# Altium project 2026_HSS_Kontrocu_Karti.PrjPcb
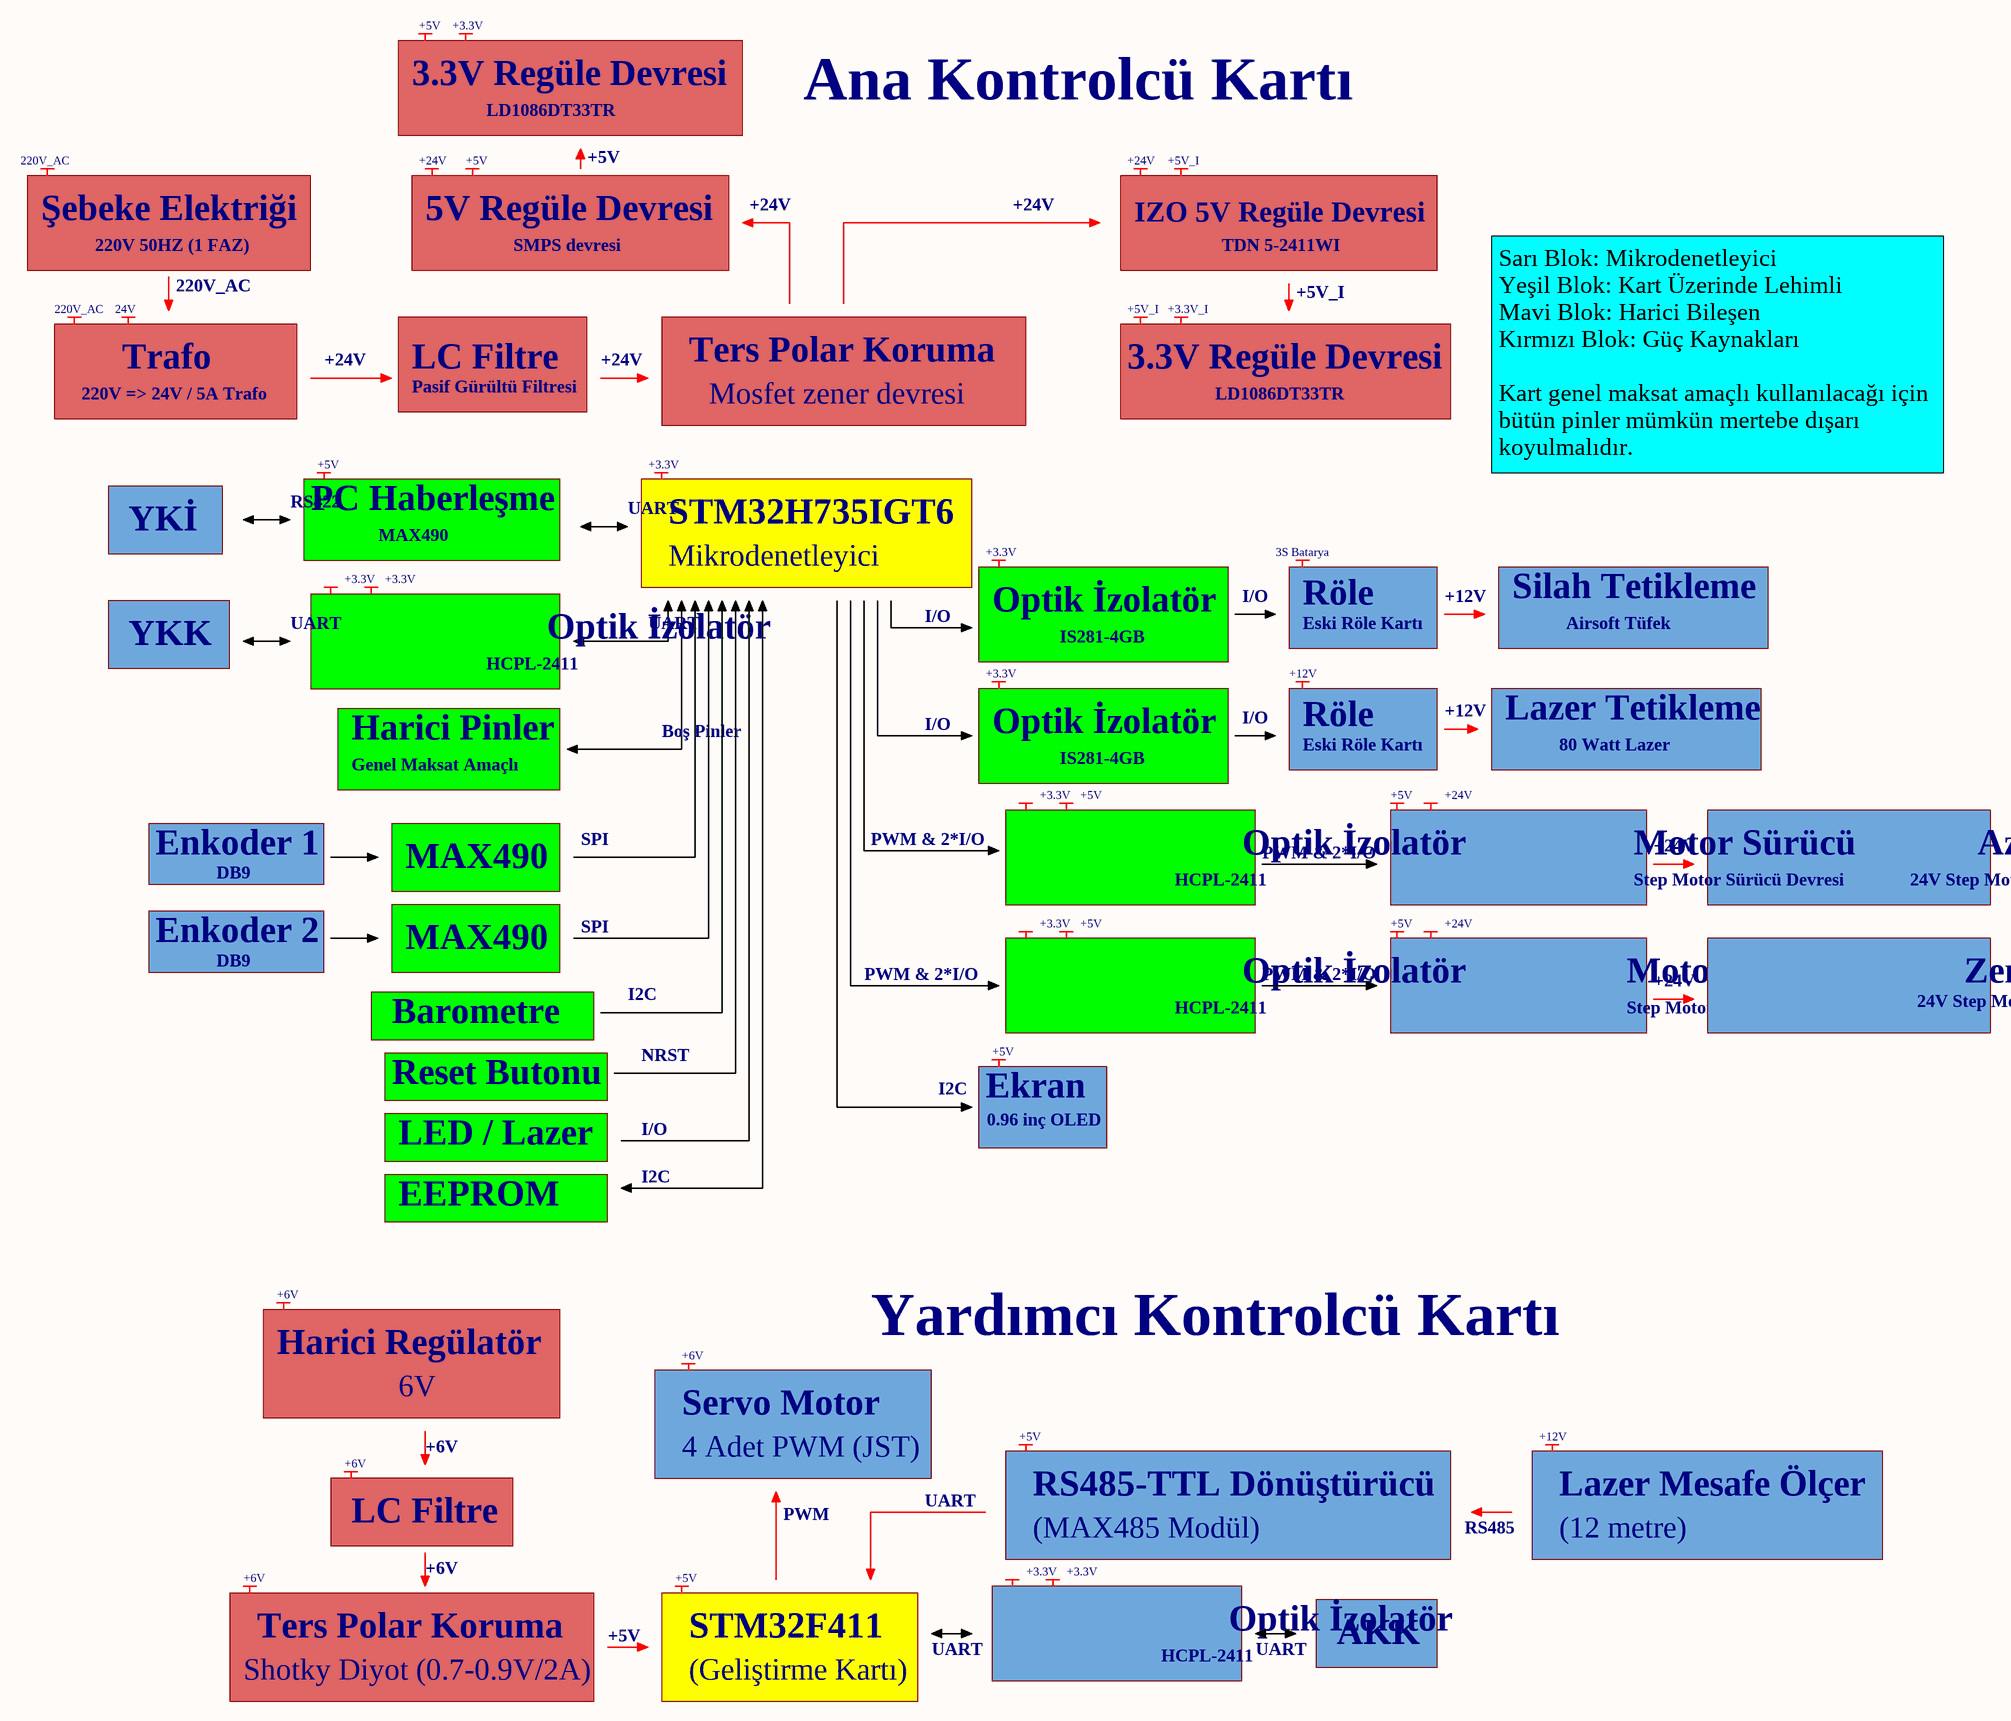
[diagram p0: HSS 2026 Blok Diyagram.SchDoc]
7 sheets, 289 parts. Net scope: global (net labels, ports and power ports of the same name join across sheets).
Board file: HSS_2026_PCB.PcbDoc
Sheets:
  HSS 2026 Blok Diyagram.SchDoc
  Power Sematik.SchDoc
  STM32 Sematik.SchDoc
  Dahili Moduller 1.SchDoc
  Harici Moduller.SchDoc
  Dahili Moduller 2.SchDoc
  Dahili Moduller 3.SchDoc

## Sheet HSS 2026 Blok Diyagram.SchDoc
size A2; SheetNumber: 1; SheetTotal: 7

### Notes on the sheet
- +5V
- +3.3V
- 3.3V Regüle Devresi
- 220V_AC
- +24V
- LD1086DT33TR
- Ana Kontrolcü Kartı
- +5V_I
- Şebeke Elektriği
- 5V Regüle Devresi
- IZO 5V Regüle Devresi
- 220V 50HZ (1 FAZ)
- 24V
- SMPS devresi
- +3.3V_I
- TDN 5-2411WI
- Trafo
- LC Filtre
- Ters Polar Koruma
- 220V => 24V / 5A Trafo
- Pasif Gürültü Filtresi
- Mosfet zener devresi
- RS422
- Sarı Blok: Mikrodenetleyici
  Yeşil Blok: Kart Üzerinde Lehimli
  Mavi Blok: Harici Bileşen
  Kırmızı Blok: Güç Kaynakları
  Kart genel maksat amaçlı kullanılacağı için bütün pinler mümkün mertebe dışarı koyulmalıdır.
- YKİ
- PC Haberleşme
- MAX490
- UART
- STM32H735IGT6
- Mikrodenetleyici
- 3S Batarya
- Optik İzolatör
- I/O
- IS281-4GB
- Röle
- Eski Röle Kartı
- +12V
- Silah Tetikleme
- Airsoft Tüfek
- YKK
- HCPL-2411
- Reset Butonu
  2 Kristal
  Uyarı LED'leri
  Boş butonlar
  PWM/+5V/GND
- Harici Pinler
- Genel Maksat Amaçlı
- Boş Pinler
- Lazer Tetikleme
- 80 Watt Lazer
- SPI
- PWM & 2*I/O
- Enkoder 1
- DB9
- Motor Sürücü
- Step Motor Sürücü Devresi
- 24V Step Motor
- Azimuth Motoru
- Enkoder 2
- Zenith Motoru
- Barometre
- I2C
- Reset Butonu
- NRST
- Ekran
- LED / Lazer
- 0.96 inç OLED
- EEPROM
- +6V
- Harici Regülatör
- Yardımcı Kontrolcü Kartı
- 6V
- Servo Motor
- 4 Adet PWM (JST)
- PWM
- RS485-TTL Dönüştürücü
- Lazer Mesafe Ölçer
- (MAX485 Modül)
- RS485
- (12 metre)
- STM32F411
- AKK
- Shotky Diyot (0.7-0.9V/2A)
- Dikkat kartın regülatörü max 5.25V
- (Geliştirme Kartı)

## Sheet Power Sematik.SchDoc
size A4; SheetNumber: 2; SheetTotal: 7
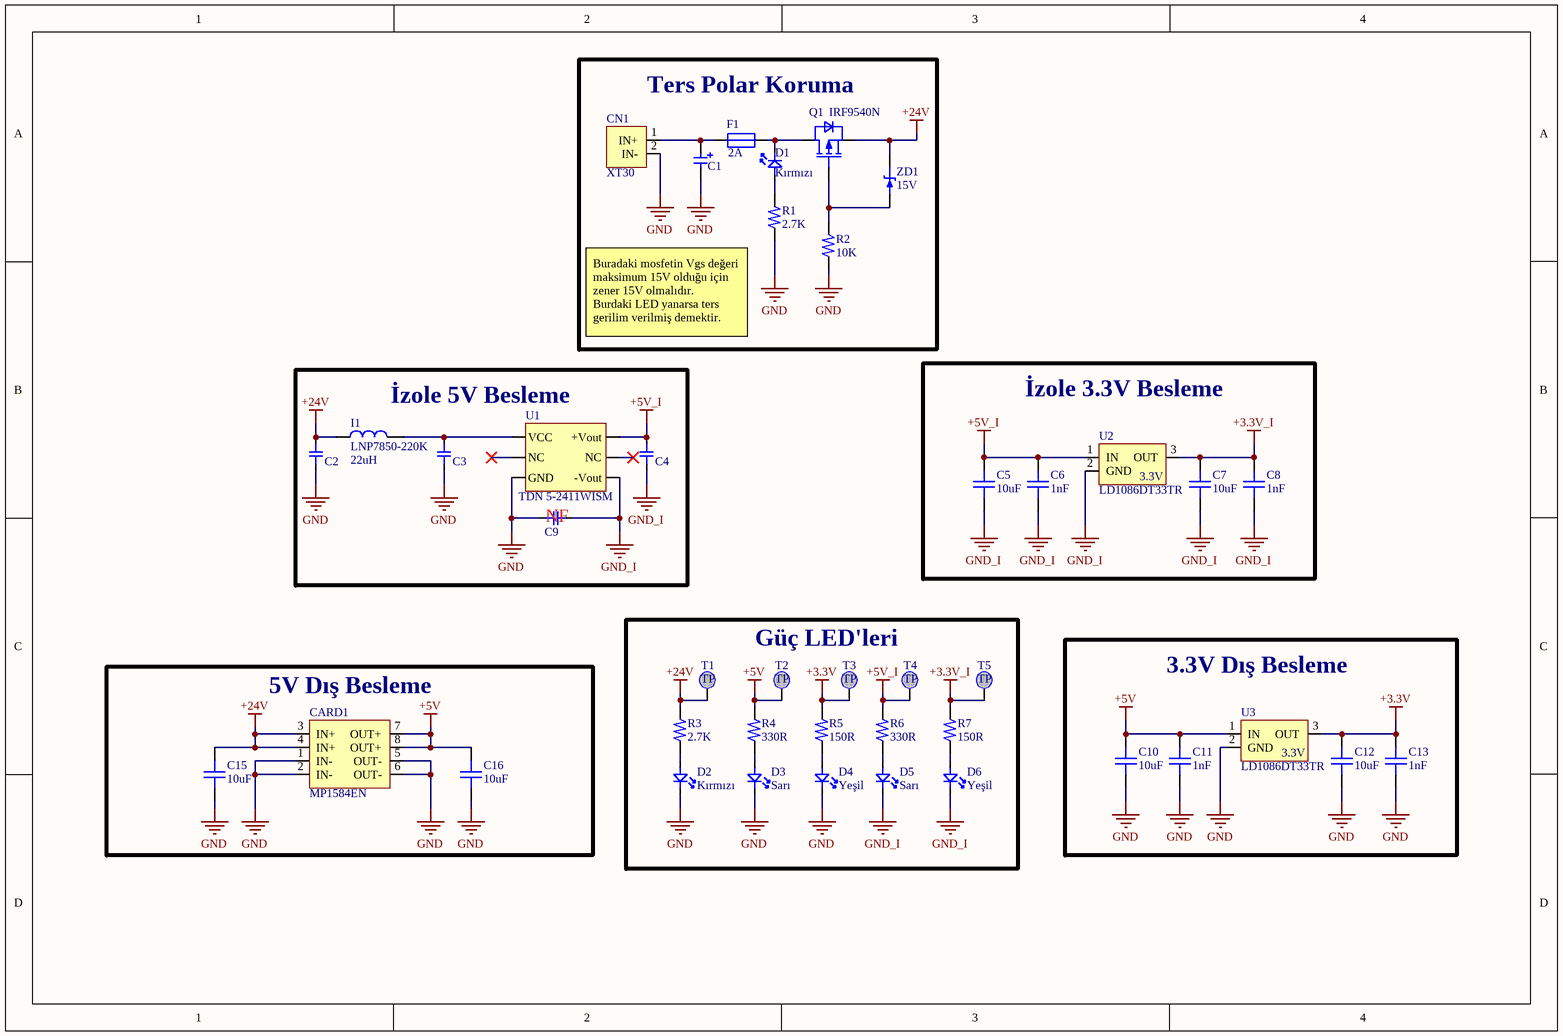
[diagram p1: Power Sematik.SchDoc]

### Parts
C1  CAP_Elec  [CAP_Elec]  (value not drawn)
C2  10uF/50V  [1206_Kapasitör]  (value not drawn)
C3  2.2uF/50V  [1206_Kapasitör]  (value not drawn)
C4  10uF  [1206_Kapasitör]  (value not drawn)
C5  10uF  [0805 Kapasıtor]
C6  1nF  [0805 Kapasıtor]
C7  10uF  [0805 Kapasıtor]
C8  1nF  [0805 Kapasıtor]
C9  330pF/3kV  [1206_Kapasitör]  (value not drawn)
C10  10uF  [0805 Kapasıtor]
C11  1nF  [0805 Kapasıtor]
C12  10uF  [0805 Kapasıtor]
C13  1nF  [0805 Kapasıtor]
C15  10uF  [0805 Kapasıtor]
C16  10uF  [0805 Kapasıtor]
CARD1  MP1584EN  [MP1584]
CN1  XT30  [XT30]
D1  Kırmızı  [0805 LED]
D2  Kırmızı  [0805 LED]
D3  Sarı  [0805 LED]
D4  Yeşil  [0805 LED]
D5  Sarı  [0805 LED]
D6  Yeşil  [0805 LED]
F1  2A  [1808_Sigorta]
I1  LNP7850-220K  value 22uH  [LPN7850]
Q1  IRF9540N  [IFX-PG-TO220-3-904-1]
R1  2.7K  [0805 Dırenc]
R2  10K  [0805 Dırenc]
R3  2.7K  [0805 Dırenc]
R4  330R  [0805 Dırenc]
R5  150R  [0805 Dırenc]
R6  330R  [0805 Dırenc]
R7  150R  [0805 Dırenc]
T1  Test Noktası  [Test Noktası]  (value not drawn)
T2  Test Noktası  [Test Noktası]  (value not drawn)
T3  Test Noktası  [Test Noktası]  (value not drawn)
T4  Test Noktası  [Test Noktası]  (value not drawn)
T5  Test Noktası  [Test Noktası]  (value not drawn)
U1  TDN 5-2411WISM  [Traco 5WISM]
U2  LD1086DT33TR  [DPAK]
U3  LD1086DT33TR  [DPAK]
ZD1  15V  [Zener_Diyot]

### Blocks framed on the sheet
Ters Polar Koruma: C1 CN1 D1 F1 Q1 R1 R2 ZD1
İzole 5V Besleme: C2-C4 C9 I1 U1
İzole 3.3V Besleme: C5-C8 U2
Güç LED'leri: D2-D6 R3-R7 T1-T5
5V Dış Besleme: C15 C16 CARD1
3.3V Dış Besleme: C10-C13 U3

### Nets
+3.3V: C12.2 C13.2 R5.2 T3.1 U3.3(OUT)
+3.3V_I: C7.2 C8.2 R7.2 T5.1 U2.3(OUT)
+5V: C10.2 C11.2 C16.2 CARD1.7(OUT+) CARD1.8(OUT+) R4.2 T2.1 U3.1(IN)
+5V_I: C4.1 C5.2 C6.2 R6.2 T4.1 U1.7(+Vout) U2.1(IN)
+24V: C2.2 C15.2 CARD1.3(IN+) CARD1.4(IN+) I1.1 Q1.3(SOURCE) R3.2 T1.1 ZD1.2(K)
GND: C1.2 C2.1 C3.1 C9.2 C10.1 C11.1 C12.1 C13.1 C15.1 C16.1 CARD1.1(IN-) CARD1.2(IN-) CARD1.5(OUT-) CARD1.6(OUT-) CN1.2(IN-) D2.2 D3.2 D4.2 R1.1 R2.1 U1.2(GND) U3.2(GND)
GND_I: C4.2 C5.1 C6.1 C7.1 C8.1 C9.1 D5.2 D6.2 U1.6(-Vout) U2.2(GND)
NetC1_1: C1.1 CN1.1(IN+) F1.1
NetC3_2: C3.2 I1.2 U1.1(VCC)
NetD1_1: D1.1 R1.2
NetD1_2: D1.2 F1.2 Q1.2(DRAIN)
NetD2_1: D2.1 R3.1
NetD3_1: D3.1 R4.1
NetD4_1: D4.1 R5.1
NetD5_1: D5.1 R6.1
NetD6_1: D6.1 R7.1
NetQ1_1: Q1.1(GATE) R2.2 ZD1.1(A)

Not connected (* = marked no-connect by the designer): U1 4(NC)* 5(NC)*

### Notes on the sheet
- (near R1) Buradaki mosfetin Vgs değeri maksimum 15V olduğu için zener 15V olmalıdır.
  Burdaki LED yanarsa ters gerilim verilmiş demektir.
- (near C9) NF
- (in symbol LD1086DT33TR) 3.3V
- (in symbol Test Noktası) TP

### Library data of the parts
C2-C4 C9 = 1206 CAP
C5-C8 C10-C13 C15 C16 = Kapasitor 0805
CARD1 = MP1584EN_kartı
D1-D6 = 0805 LED
F1 = 1808_Sigorta
Q1 = IRF9540N: OptiMOS - P2 Power-Transistor, P-channel-Enhancement mode, VDS -30V; Manufacturer: Infineon Technologies; Manufacturer Order NumberManufacturer Order Number: IRF9540N; PackageReference: PG-TO220-3-904
R1-R7 = Direnc 0805
ZD1 = BZV55C18
C1 = CAP_Elec: Value: *

## Sheet STM32 Sematik.SchDoc
size A4; SheetNumber: 3; SheetTotal: 7
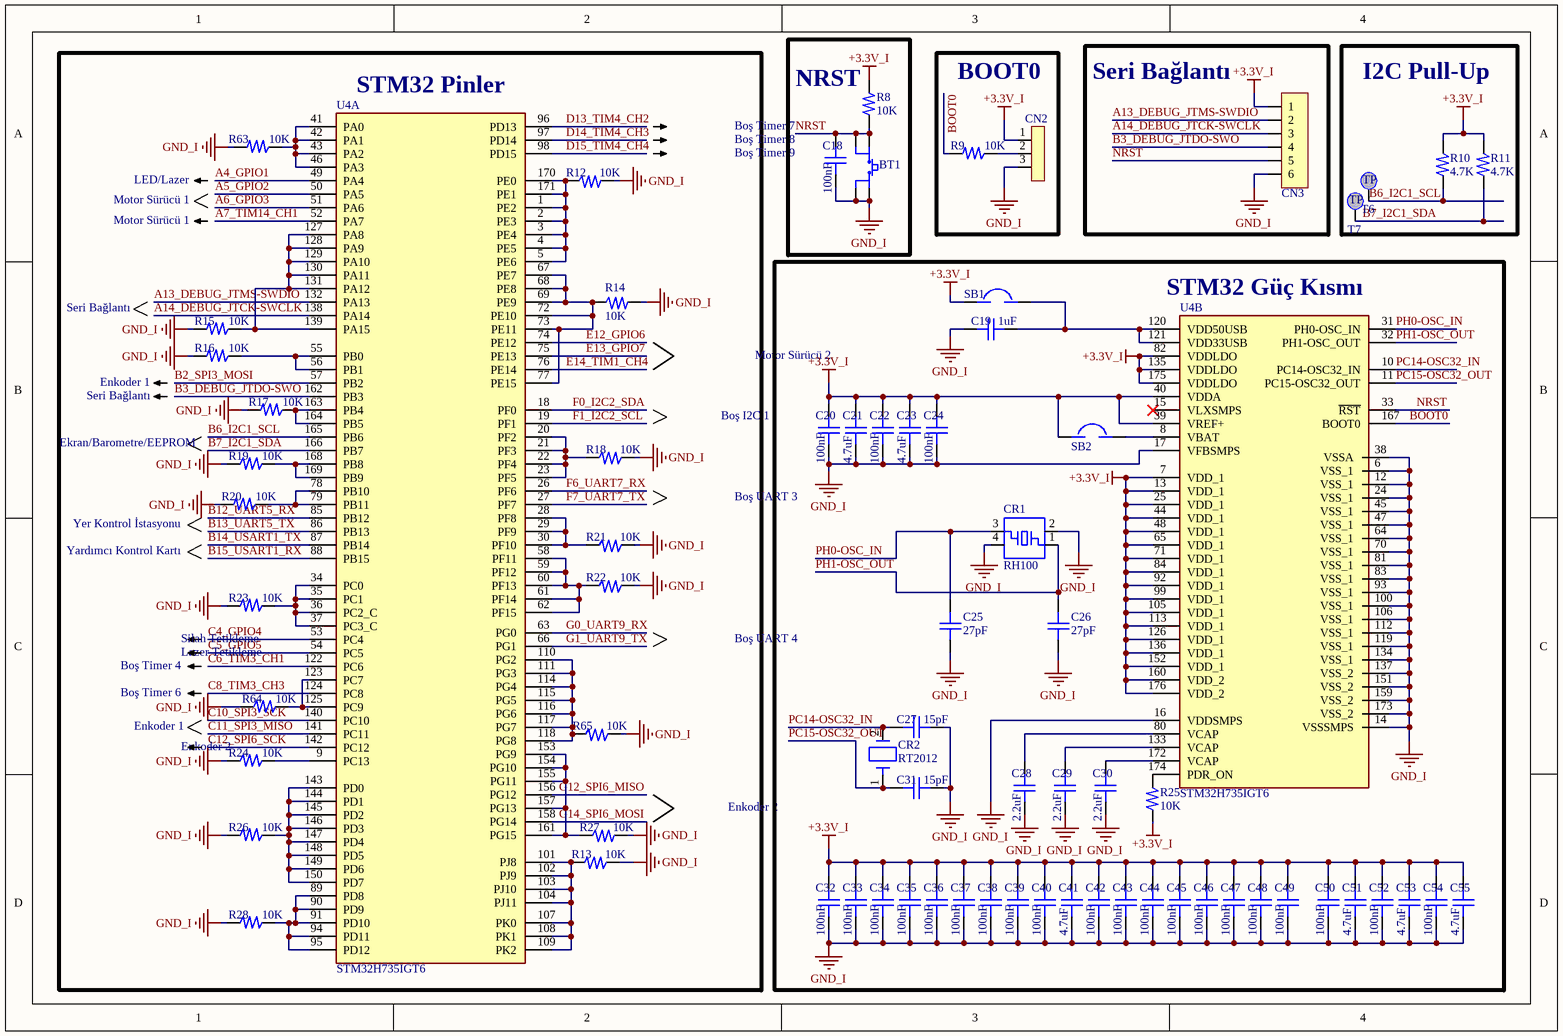
[diagram p2: STM32 Sematik.SchDoc]

### Parts
BT1  5_mm_Buton  [5mm_buton]  (value not drawn)
C18  100nF  [0805 Kapasıtor]
C19  1uF  [0805 Kapasıtor]
C20  100nF  [0805 Kapasıtor]
C21  4.7uF  [0805 Kapasıtor]
C22  100nF  [0805 Kapasıtor]
C23  4.7uF  [0805 Kapasıtor]
C24  100nF  [0805 Kapasıtor]
C25  27pF  [0805 Kapasıtor]
C26  27pF  [0805 Kapasıtor]
C27  15pF  [0805 Kapasıtor]
C28  2.2uF  [0805 Kapasıtor]
C29  2.2uF  [0805 Kapasıtor]
C30  2.2uF  [0805 Kapasıtor]
C31  15pF  [0805 Kapasıtor]
C32  100nF  [0805 Kapasıtor]
C33  100nF  [0805 Kapasıtor]
C34  100nF  [0805 Kapasıtor]
C35  100nF  [0805 Kapasıtor]
C36  100nF  [0805 Kapasıtor]
C37  100nF  [0805 Kapasıtor]
C38  100nF  [0805 Kapasıtor]
C39  100nF  [0805 Kapasıtor]
C40  100nF  [0805 Kapasıtor]
C41  4.7uF  [0805 Kapasıtor]
C42  100nF  [0805 Kapasıtor]
C43  100nF  [0805 Kapasıtor]
C44  100nF  [0805 Kapasıtor]
C45  100nF  [0805 Kapasıtor]
C46  100nF  [0805 Kapasıtor]
C47  100nF  [0805 Kapasıtor]
C48  100nF  [0805 Kapasıtor]
C49  100nF  [0805 Kapasıtor]
C50  100nF  [0805 Kapasıtor]
C51  4.7uF  [0805 Kapasıtor]
C52  100nF  [0805 Kapasıtor]
C53  4.7uF  [0805 Kapasıtor]
C54  100nF  [0805 Kapasıtor]
C55  4.7uF  [0805 Kapasıtor]
CN2  3_Pin_Header  [3_PIN_HEADER]  (value not drawn)
CN3  6_Pin_JST_Male  [6_Pin_JST_Male]  (value not drawn)
CR1  RH100  [RH100]
CR2  RT2012  [RT2012]
R8  10K  [0805 Dırenc]
R9  10K  [0805 Dırenc]
R10  4.7K  [0805 Dırenc]
R11  4.7K  [0805 Dırenc]
R12  10K  [0805 Dırenc]
R13  10K  [0805 Dırenc]
R14  10K  [0805 Dırenc]
R15  10K  [0805 Dırenc]
R16  10K  [0805 Dırenc]
R17  10K  [0805 Dırenc]
R18  10K  [0805 Dırenc]
R19  10K  [0805 Dırenc]
R20  10K  [0805 Dırenc]
R21  10K  [0805 Dırenc]
R22  10K  [0805 Dırenc]
R23  10K  [0805 Dırenc]
R24  10K  [0805 Dırenc]
R25  10K  [0805 Dırenc]
R26  10K  [0805 Dırenc]
R27  10K  [0805 Dırenc]
R28  10K  [0805 Dırenc]
R63  10K  [0805 Dırenc]
R64  10K  [0805 Dırenc]
R65  10K  [0805 Dırenc]
SB1  Solder_Bridge  [Solder_Bridge]  (value not drawn)
SB2  Solder_Bridge  [Solder_Bridge]  (value not drawn)
T6  Test Noktası  [Test Noktası]  (value not drawn)
T7  Test Noktası  [Test Noktası]  (value not drawn)
U4  STM32H735IGT6  [LQFP-176]  (parts A,B of 2)

### Blocks framed on the sheet
STM32 Pinler: R12-R24 R26-R28 R63-R65 U4
NRST: BT1 C18 R8
BOOT0: CN2 R9
Seri Bağlantı: CN3
I2C Pull-Up: R10 R11 T6 T7
STM32 Güç Kısmı: C19-C55 CR1 CR2 R25 SB1 SB2 U4

### Nets
+3.3V_I: C20.2 C21.2 C22.2 C23.2 C24.2 C32.2 C33.2 C34.2 C35.2 C36.2 C37.2 C38.2 C39.2 C40.2 C41.2 C42.2 C43.2 C44.2 C45.2 C46.2 C47.2 C48.2 C49.2 C50.2 C51.2 C52.2 C53.2 C54.2 C55.2 CN2.1 CN3.1 R8.2 R10.2 R11.2 R25.1 SB1.1 SB2.1 U4.7(VDD_1) U4.13(VDD_1) U4.25(VDD_1) U4.39(VREF+) U4.40(VDDA) U4.44(VDD_1) U4.48(VDD_1) U4.65(VDD_1) U4.71(VDD_1) U4.82(VDDLDO) U4.84(VDD_1) U4.92(VDD_1) U4.99(VDD_1) U4.105(VDD_1) U4.113(VDD_1) U4.126(VDD_1) U4.135(VDDLDO) U4.136(VDD_1) U4.152(VDD_1) U4.160(VDD_2) U4.175(VDDLDO) U4.176(VDD_2)
GND_I: BT1.2 BT1.3 C18.1 C19.1 C20.1 C21.1 C22.1 C23.1 C24.1 C25.1 C26.1 C27.2 C28.1 C29.1 C30.1 C31.2 C32.1 C33.1 C34.1 C35.1 C36.1 C37.1 C38.1 C39.1 C40.1 C41.1 C42.1 C43.1 C44.1 C45.1 C46.1 C47.1 C48.1 C49.1 C50.1 C51.1 C52.1 C53.1 C54.1 C55.1 CN2.3 CN3.6 CR1.2 CR1.4 R12.1 R13.1 R14.1 R15.1 R16.1 R17.1 R18.1 R19.1 R20.1 R21.1 R22.1 R23.1 R24.1 R26.1 R27.1 R28.1 R63.1 R64.1 R65.1 U4.6(VSS_1) U4.12(VSS_1) U4.14(VSSSMPS) U4.16(VDDSMPS) U4.17(VFBSMPS) U4.24(VSS_1) U4.38(VSSA) U4.45(VSS_1) U4.47(VSS_1) U4.64(VSS_1) U4.70(VSS_1) U4.81(VSS_1) U4.83(VSS_1) U4.93(VSS_1) U4.100(VSS_1) U4.106(VSS_1) U4.112(VSS_1) U4.119(VSS_1) U4.134(VSS_1) U4.137(VSS_2) U4.151(VSS_2) U4.159(VSS_2) U4.173(VSS_2)
A4_GPIO1: U4.49(PA4)
A5_GPIO2: U4.50(PA5)
A6_GPIO3: U4.51(PA6)
A7_TIM14_CH1: U4.52(PA7)
A13_DEBUG_JTMS-SWDIO: CN3.2 U4.132(PA13)
A14_DEBUG_JTCK-SWCLK: CN3.3 U4.138(PA14)
B2_SPI3_MOSI: U4.57(PB2)
B3_DEBUG_JTDO-SWO: CN3.4 U4.162(PB3)
B6_I2C1_SCL: R10.1 T6.1 U4.165(PB6)
B7_I2C1_SDA: R11.1 T7.1 U4.166(PB7)
B12_UART5_RX: U4.85(PB12)
B13_UART5_TX: U4.86(PB13)
B14_USART1_TX: U4.87(PB14)
B15_USART1_RX: U4.88(PB15)
BOOT0: R9.1 U4.167(BOOT0)
C4_GPIO4: U4.53(PC4)
C5_GPIO5: U4.54(PC5)
C6_TIM3_CH1: U4.122(PC6)
C8_TIM3_CH3: U4.124(PC8)
C10_SPI3_SCK: U4.140(PC10)
C11_SPI3_MISO: U4.141(PC11)
C12_SPI6_SCK: U4.142(PC12)
D13_TIM4_CH2: U4.96(PD13)
D14_TIM4_CH3: U4.97(PD14)
D15_TIM4_CH4: U4.98(PD15)
E12_GPIO6: U4.74(PE12)
E13_GPIO7: U4.75(PE13)
E14_TIM1_CH4: U4.76(PE14)
F0_I2C2_SDA: U4.18(PF0)
F1_I2C2_SCL: U4.19(PF1)
F6_UART7_RX: U4.26(PF6)
F7_UART7_TX: U4.27(PF7)
G0_UART9_RX: U4.63(PG0)
G1_UART9_TX: U4.66(PG1)
G12_SPI6_MISO: U4.156(PG12)
G14_SPI6_MOSI: U4.158(PG14)
NRST: BT1.1 BT1.4 C18.2 CN3.5 R8.1 U4.33(~{RST})
PC14-OSC32_IN: C27.1 CR2.2 U4.10(PC14-OSC32_IN)
PC15-OSC32_OUT: C31.1 CR2.1 U4.11(PC15-OSC32_OUT)
PH0-OSC_IN: C25.2 CR1.3 U4.31(PH0-OSC_IN)
PH1-OSC_OUT: C26.2 CR1.1 U4.32(PH1-OSC_OUT)
NetC19_2: C19.2 SB1.2 U4.120(VDD50USB) U4.121(VDD33USB)
NetC28_2: C28.2 U4.80(VCAP)
NetC29_2: C29.2 U4.133(VCAP)
NetC30_2: C30.2 U4.172(VCAP)
NetCN2_2: CN2.2 R9.2
NetR12_2: R12.2 U4.1(PE2) U4.2(PE3) U4.3(PE4) U4.4(PE5) U4.5(PE6) U4.170(PE0) U4.171(PE1)
NetR13_2: R13.2 U4.101(PJ8) U4.102(PJ9) U4.103(PJ10) U4.104(PJ11) U4.107(PK0) U4.108(PK1) U4.109(PK2)
NetR14_2: R14.2 U4.67(PE7) U4.68(PE8) U4.69(PE9) U4.72(PE10) U4.73(PE11) U4.77(PE15)
NetR15_2: R15.2 U4.127(PA8) U4.128(PA9) U4.129(PA10) U4.130(PA11) U4.131(PA12) U4.139(PA15)
NetR16_2: R16.2 U4.55(PB0) U4.56(PB1)
NetR17_2: R17.2 U4.163(PB4) U4.164(PB5)
NetR18_2: R18.2 U4.20(PF2) U4.21(PF3) U4.22(PF4) U4.23(PF5)
NetR19_2: R19.2 U4.168(PB8) U4.169(PB9)
NetR20_2: R20.2 U4.78(PB10) U4.79(PB11)
NetR21_2: R21.2 U4.28(PF8) U4.29(PF9) U4.30(PF10)
NetR22_2: R22.2 U4.58(PF11) U4.59(PF12) U4.60(PF13) U4.61(PF14) U4.62(PF15)
NetR23_2: R23.2 U4.34(PC0) U4.35(PC1) U4.36(PC2_C) U4.37(PC3_C)
NetR24_2: R24.2 U4.9(PC13)
NetR25_2: R25.2 U4.174(PDR_ON)
NetR26_2: R26.2 U4.143(PD0) U4.144(PD1) U4.145(PD2) U4.146(PD3) U4.147(PD4) U4.148(PD5) U4.149(PD6) U4.150(PD7)
NetR27_2: R27.2 U4.153(PG9) U4.154(PG10) U4.155(PG11) U4.157(PG13) U4.161(PG15)
NetR28_2: R28.2 U4.89(PD8) U4.90(PD9) U4.91(PD10) U4.94(PD11) U4.95(PD12)
NetR63_2: R63.2 U4.41(PA0) U4.42(PA1) U4.43(PA2) U4.46(PA3)
NetR64_2: R64.2 U4.123(PC7) U4.125(PC9)
NetR65_2: R65.2 U4.110(PG2) U4.111(PG3) U4.114(PG4) U4.115(PG5) U4.116(PG6) U4.117(PG7) U4.118(PG8)
NetSB2_2: SB2.2 U4.8(VBAT)

Not connected (* = marked no-connect by the designer): U4 15(VLXSMPS)*

### Notes on the sheet
- Boş Timer 7
- Boş Timer 8
- Boş Timer 9
- Motor Sürücü 1
- LED/Lazer
- Seri Bağlantı
- Enkoder 1
- Motor Sürücü 2
- Ekran/Barometre/EEPROM
- Boş I2C 1
- Boş UART 3
- Yardımcı Kontrol Kartı
- (near R20) Yer Kontrol İstasyonu
- Lazer Tetikleme
- Silah Tetikleme
- Boş UART 4
- Boş Timer 4
- Boş Timer 6
- Enkoder 2
- (in symbol Test Noktası) TP

### Library data of the parts
C18-C55 = Kapasitor 0805
CN2 = 3_Pin_2.54mm
CR1 = 16_MHz_Crystal
CR2 = RT2012_Kristal
R8-R28 R63-R65 = Direnc 0805
SB1 SB2 = Lehim Köprüsü
U4 = STM32H735IGT6: ARM® Cortex®-M7 STM32H7 Microcontroller IC 32-Bit 550MHz 1MB (1M x 8) FLASH 176-LQFP (24x24); MF: STMicroelectronics; SnapEDA_Link: https://www.snapeda.com/parts/STM32H735IGT6/STMicroelectronics/view-part/?ref=snap; Package: LQFP-176 STMicroelectronics; Value: *; MP: STM32H735IGT6; Check_prices: https://www.snapeda.com/parts/STM32H735IGT6/STMicroelectronics/view-part/?ref=eda

## Sheet Dahili Moduller 1.SchDoc
size A4; SheetNumber: 4; SheetTotal: 7
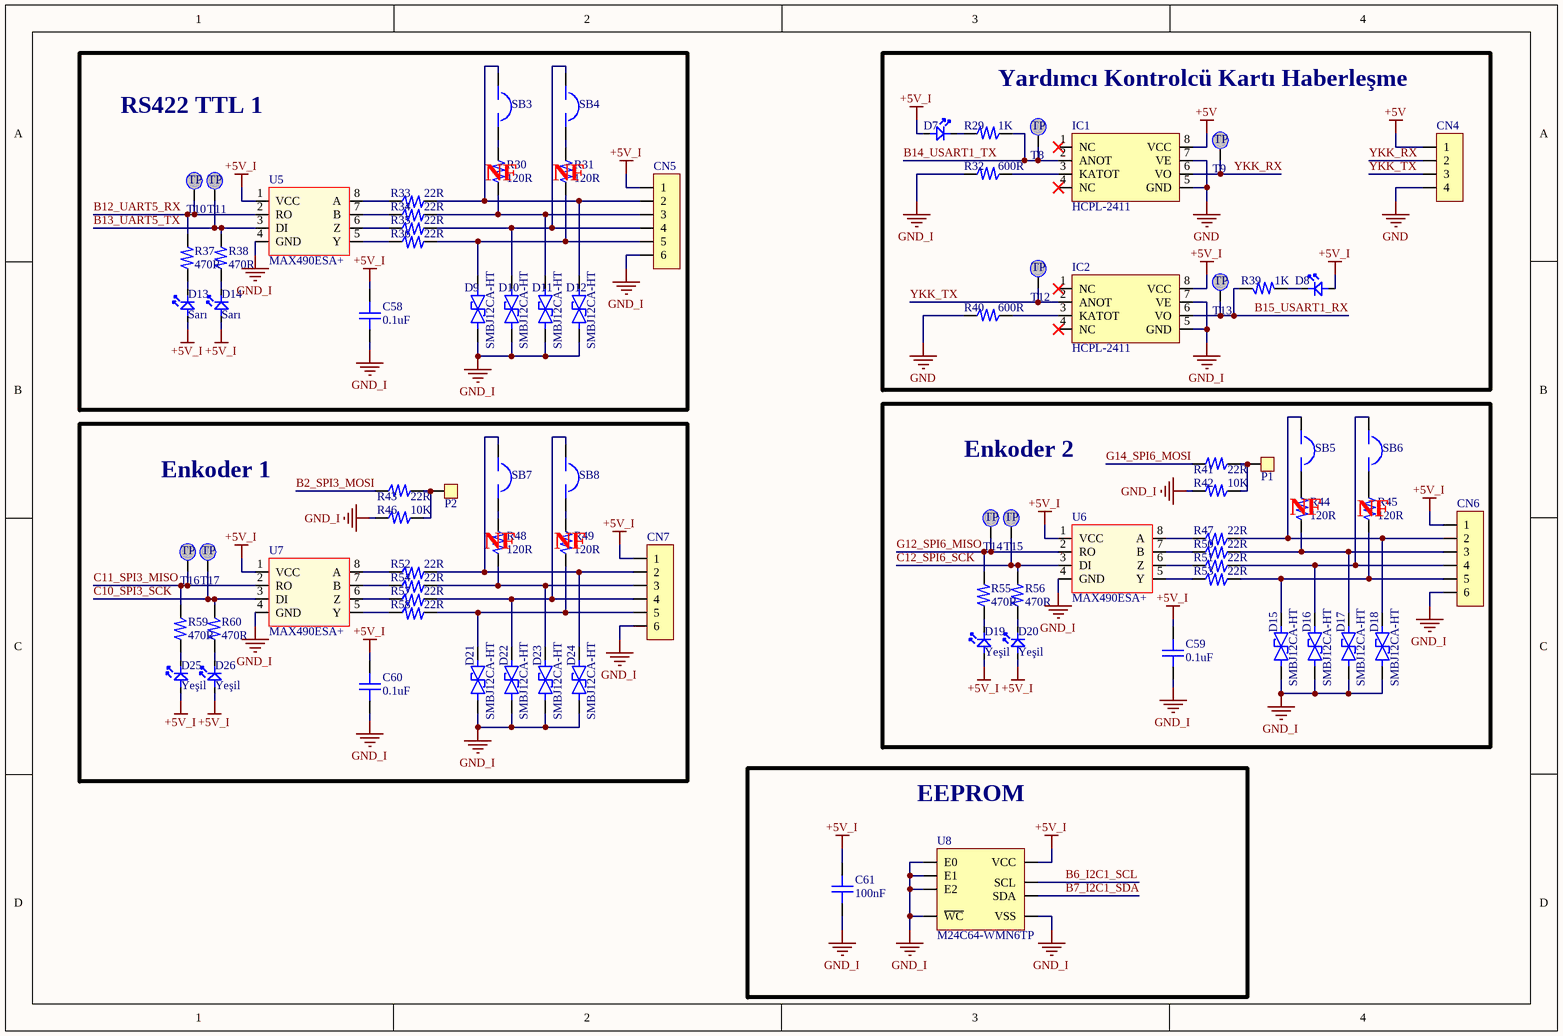
[diagram p3: Dahili Moduller 1.SchDoc]

### Parts
C58  0.1uF  [0805 Kapasıtor]
C59  0.1uF  [0805 Kapasıtor]
C60  0.1uF  [0805 Kapasıtor]
C61  100nF  [0805 Kapasıtor]
CN4  4_Pin_JST_Male  [4_Pin_JST_Male]  (value not drawn)
CN5  6_Pin_JST_Male  [6_Pin_JST_Male]  (value not drawn)
CN6  6_Pin_JST_Male  [6_Pin_JST_Male]  (value not drawn)
CN7  6_Pin_JST_Male  [6_Pin_JST_Male]  (value not drawn)
D7  0805 LED  [0805 LED]  (value not drawn)
D8  0805 LED  [0805 LED]  (value not drawn)
D9  SMBJ12CA-HT  [SMB/DO-214AA]
D10  SMBJ12CA-HT  [SMB/DO-214AA]
D11  SMBJ12CA-HT  [SMB/DO-214AA]
D12  SMBJ12CA-HT  [SMB/DO-214AA]
D13  Sarı  [0805 LED]
D14  Sarı  [0805 LED]
D15  SMBJ12CA-HT  [SMB/DO-214AA]
D16  SMBJ12CA-HT  [SMB/DO-214AA]
D17  SMBJ12CA-HT  [SMB/DO-214AA]
D18  SMBJ12CA-HT  [SMB/DO-214AA]
D19  Yeşil  [0805 LED]
D20  Yeşil  [0805 LED]
D21  SMBJ12CA-HT  [SMB/DO-214AA]
D22  SMBJ12CA-HT  [SMB/DO-214AA]
D23  SMBJ12CA-HT  [SMB/DO-214AA]
D24  SMBJ12CA-HT  [SMB/DO-214AA]
D25  Yeşil  [0805 LED]
D26  Yeşil  [0805 LED]
IC1  HCPL-2411  [DIP8-2.54]
IC2  HCPL-2411  [DIP8-2.54]
P1  ped  [ped]  (value not drawn)
P2  ped  [ped]  (value not drawn)
R29  1K  [0805 Dırenc]
R30  120R  [0805 Dırenc]
R31  120R  [0805 Dırenc]
R32  600R  [0805 Dırenc]
R33  22R  [0805 Dırenc]
R34  22R  [0805 Dırenc]
R35  22R  [0805 Dırenc]
R36  22R  [0805 Dırenc]
R37  470R  [0805 Dırenc]
R38  470R  [0805 Dırenc]
R39  1K  [0805 Dırenc]
R40  600R  [0805 Dırenc]
R41  22R  [0805 Dırenc]
R42  10K  [0805 Dırenc]
R43  22R  [0805 Dırenc]
R44  120R  [0805 Dırenc]
R45  120R  [0805 Dırenc]
R46  10K  [0805 Dırenc]
R47  22R  [0805 Dırenc]
R48  120R  [0805 Dırenc]
R49  120R  [0805 Dırenc]
R50  22R  [0805 Dırenc]
R51  22R  [0805 Dırenc]
R52  22R  [0805 Dırenc]
R53  22R  [0805 Dırenc]
R54  22R  [0805 Dırenc]
R55  470R  [0805 Dırenc]
R56  470R  [0805 Dırenc]
R57  22R  [0805 Dırenc]
R58  22R  [0805 Dırenc]
R59  470R  [0805 Dırenc]
R60  470R  [0805 Dırenc]
SB3  Solder_Bridge  [Solder_Bridge]  (value not drawn)
SB4  Solder_Bridge  [Solder_Bridge]  (value not drawn)
SB5  Solder_Bridge  [Solder_Bridge]  (value not drawn)
SB6  Solder_Bridge  [Solder_Bridge]  (value not drawn)
SB7  Solder_Bridge  [Solder_Bridge]  (value not drawn)
SB8  Solder_Bridge  [Solder_Bridge]  (value not drawn)
T8  Test Noktası  [Test Noktası]  (value not drawn)
T9  Test Noktası  [Test Noktası]  (value not drawn)
T10  Test Noktası  [Test Noktası]  (value not drawn)
T11  Test Noktası  [Test Noktası]  (value not drawn)
T12  Test Noktası  [Test Noktası]  (value not drawn)
T13  Test Noktası  [Test Noktası]  (value not drawn)
T14  Test Noktası  [Test Noktası]  (value not drawn)
T15  Test Noktası  [Test Noktası]  (value not drawn)
T16  Test Noktası  [Test Noktası]  (value not drawn)
T17  Test Noktası  [Test Noktası]  (value not drawn)
U5  MAX490ESA+  [8-SOIC]
U6  MAX490ESA+  [8-SOIC]
U7  MAX490ESA+  [8-SOIC]
U8  M24C64-WMN6TP  [SOIC127P600X175-8N]

### Blocks framed on the sheet
Yardımcı Kontrolcü Kartı Haberleşme: CN4 D7 D8 IC1 IC2 R29 R32 R39 R40 T8 T9 T12 T13
EEPROM: C61 U8

### Nets
+5V: CN4.1 IC1.8(VCC)
+5V_I: C58.2 C59.2 C60.2 C61.2 CN5.1 CN6.1 CN7.1 D7.1 D8.1 D13.1 D14.1 D19.1 D20.1 D25.1 D26.1 IC2.8(VCC) U5.1(VCC) U6.1(VCC) U7.1(VCC) U8.8(VCC)
GND: CN4.4 IC1.5(GND) IC1.7(VE) R40.1
GND_I: C58.1 C59.1 C60.1 C61.1 CN5.6 CN6.6 CN7.6 D9.1 D10.1 D11.1 D12.1 D15.1 D16.1 D17.1 D18.1 D21.1 D22.1 D23.1 D24.1 IC2.5(GND) IC2.7(VE) R32.1 R42.1 R46.1 U5.4(GND) U6.4(GND) U7.4(GND) U8.1(E0) U8.2(E1) U8.3(E2) U8.4(VSS) U8.7(~{WC})
B2_SPI3_MOSI: R43.1
B6_I2C1_SCL: U8.6(SCL)
B7_I2C1_SDA: U8.5(SDA)
B12_UART5_RX: R37.2 T10.1 U5.2(RO)
B13_UART5_TX: R38.2 T11.1 U5.3(DI)
B14_USART1_TX: IC1.2(ANOT) R29.2 T8.1
B15_USART1_RX: IC2.6(VO) R39.2 T13.1
C10_SPI3_SCK: R60.2 T17.1 U7.3(DI)
C11_SPI3_MISO: R59.2 T16.1 U7.2(RO)
C12_SPI6_SCK: R56.2 T15.1 U6.3(DI)
G12_SPI6_MISO: R55.2 T14.1 U6.2(RO)
G14_SPI6_MOSI: R41.1
YKK_RX: CN4.2 IC1.6(VO) T9.1
YKK_TX: CN4.3 IC2.2(ANOT) T12.1
NetCN5_2: CN5.2 D12.2 R33.1 SB3.1
NetCN5_3: CN5.3 D11.2 R30.2 R34.1
NetCN5_4: CN5.4 D10.2 R35.1 SB4.1
NetCN5_5: CN5.5 D9.2 R31.2 R36.1
NetCN6_2: CN6.2 D18.2 R47.1 SB5.1
NetCN6_3: CN6.3 D17.2 R44.2 R50.1
NetCN6_4: CN6.4 D16.2 R51.1 SB6.1
NetCN6_5: CN6.5 D15.2 R45.2 R53.1
NetCN7_2: CN7.2 D24.2 R52.1 SB7.1
NetCN7_3: CN7.3 D23.2 R48.2 R54.1
NetCN7_4: CN7.4 D22.2 R57.1 SB8.1
NetCN7_5: CN7.5 D21.2 R49.2 R58.1
NetD7_2: D7.2 R29.1
NetD8_2: D8.2 R39.1
NetD13_2: D13.2 R37.1
NetD14_2: D14.2 R38.1
NetD19_2: D19.2 R55.1
NetD20_2: D20.2 R56.1
NetD25_2: D25.2 R59.1
NetD26_2: D26.2 R60.1
NetIC1_3: IC1.3(KATOT) R32.2
NetIC2_3: IC2.3(KATOT) R40.2
NetP1_1: P1.1 R41.2 R42.2
NetP2_1: P2.1 R43.2 R46.2
NetR30_1: R30.1 SB3.2
NetR31_1: R31.1 SB4.2
NetR33_2: R33.2 U5.8(A)
NetR34_2: R34.2 U5.7(B)
NetR35_2: R35.2 U5.6(Z)
NetR36_2: R36.2 U5.5(Y)
NetR44_1: R44.1 SB5.2
NetR45_1: R45.1 SB6.2
NetR47_2: R47.2 U6.8(A)
NetR48_1: R48.1 SB7.2
NetR49_1: R49.1 SB8.2
NetR50_2: R50.2 U6.7(B)
NetR51_2: R51.2 U6.6(Z)
NetR52_2: R52.2 U7.8(A)
NetR53_2: R53.2 U6.5(Y)
NetR54_2: R54.2 U7.7(B)
NetR57_2: R57.2 U7.6(Z)
NetR58_2: R58.2 U7.5(Y)

Not connected (* = marked no-connect by the designer): IC1 1(NC)* 4(NC)*; IC2 1(NC)* 4(NC)*

### Notes on the sheet
- RS422 TTL 1
- (near R30) NF
- (near R31) NF
- Enkoder 1
- Enkoder 2
- (near R44) NF
- (near R45) NF
- (near R48) NF
- (near R49) NF
- (in symbol Test Noktası) TP

### Library data of the parts
C58-C61 = Kapasitor 0805
D13 D14 D19 D20 D25 D26 = 0805 LED
R29-R60 = Direnc 0805
SB3-SB8 = Lehim Köprüsü
U5-U7 = MAX490ESA+: Low-Power, Slew-Rate-Limited RS-485/RS-422 Transceivers; Manufacturer_Name: Analog Devices Inc; Copyright: Copyright (C) 2026 Ultra Librarian. All rights reserved.; Manufacturer_Part_Number: MAX490ESA+; RefDes: RefDes; Type: Type
U8 = M24C64-WMN6TP: Package: None; Price: None; Value: *; MP: M24C64-WMN6TP; Availability: Unavailable

## Sheet Harici Moduller.SchDoc
size A4; SheetNumber: 5; SheetTotal: 7
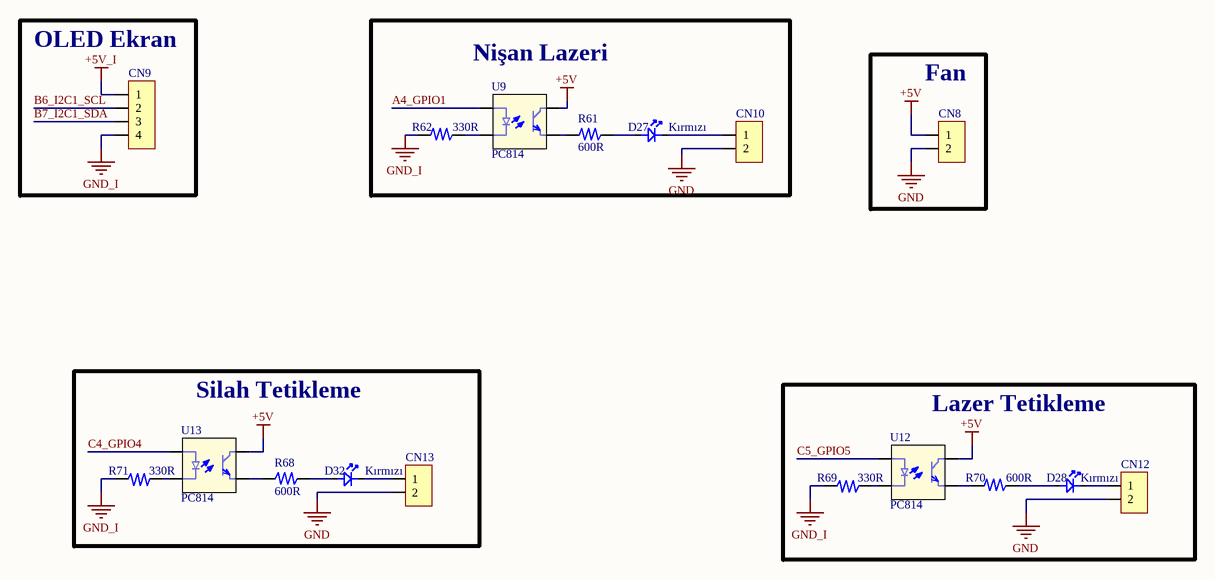
[diagram p4: Harici Moduller.SchDoc]

### Parts
CN8  2_Pin_JST_Male  [2_Pin_JST_Male]  (value not drawn)
CN9  4_Pin_JST_Male  [4_Pin_JST_Male]  (value not drawn)
CN10  2_Pin_JST_Male  [2_Pin_JST_Male]  (value not drawn)
CN12  2_Pin_JST_Male  [2_Pin_JST_Male]  (value not drawn)
CN13  2_Pin_JST_Male  [2_Pin_JST_Male]  (value not drawn)
D27  Kırmızı  [0805 LED]
D28  Kırmızı  [0805 LED]
D32  Kırmızı  [0805 LED]
R61  600R  [0805 Dırenc]
R62  330R  [0805 Dırenc]
R68  600R  [0805 Dırenc]
R69  330R  [0805 Dırenc]
R70  600R  [0805 Dırenc]
R71  330R  [0805 Dırenc]
U9  PC814  [SOIC4]
U12  PC814  [SOIC4]
U13  PC814  [SOIC4]

### Blocks framed on the sheet
OLED Ekran: CN9
Nişan Lazeri: CN10 D27 R61 R62 U9
Fan: CN8
Silah Tetikleme: CN13 D32 R68 R71 U13
Lazer Tetikleme: CN12 D28 R69 R70 U12

### Nets
+5V: CN8.1 U9.4 U12.4 U13.4
+5V_I: CN9.1
GND: CN8.2 CN10.2 CN12.2 CN13.2
GND_I: CN9.4 R62.1 R69.2 R71.2
A4_GPIO1: U9.1
B6_I2C1_SCL: CN9.2
B7_I2C1_SDA: CN9.3
C4_GPIO4: U13.1
C5_GPIO5: U12.1
NetCN10_1: CN10.1 D27.2
NetCN12_1: CN12.1 D28.2
NetCN13_1: CN13.1 D32.2
NetD27_1: D27.1 R61.2
NetD28_1: D28.1 R70.2
NetD32_1: D32.1 R68.2
NetR61_1: R61.1 U9.3
NetR62_2: R62.2 U9.2
NetR68_1: R68.1 U13.3
NetR69_1: R69.1 U12.2
NetR70_1: R70.1 U12.3
NetR71_1: R71.1 U13.2

### Library data of the parts
D27 D28 D32 = 0805 LED
R61 R62 R68-R71 = Direnc 0805
U9 U12 U13 = PC814: Description; Manufacturer_Name: Isocom; Manufacturer_Part_Number: IS2801-1; Type: Optoisolators; Copyright: Copyright (C) 2026 Ultra Librarian. All rights reserved.; RefDes: RefDes

## Sheet Dahili Moduller 2.SchDoc
size A4; SheetNumber: 6; SheetTotal: 7
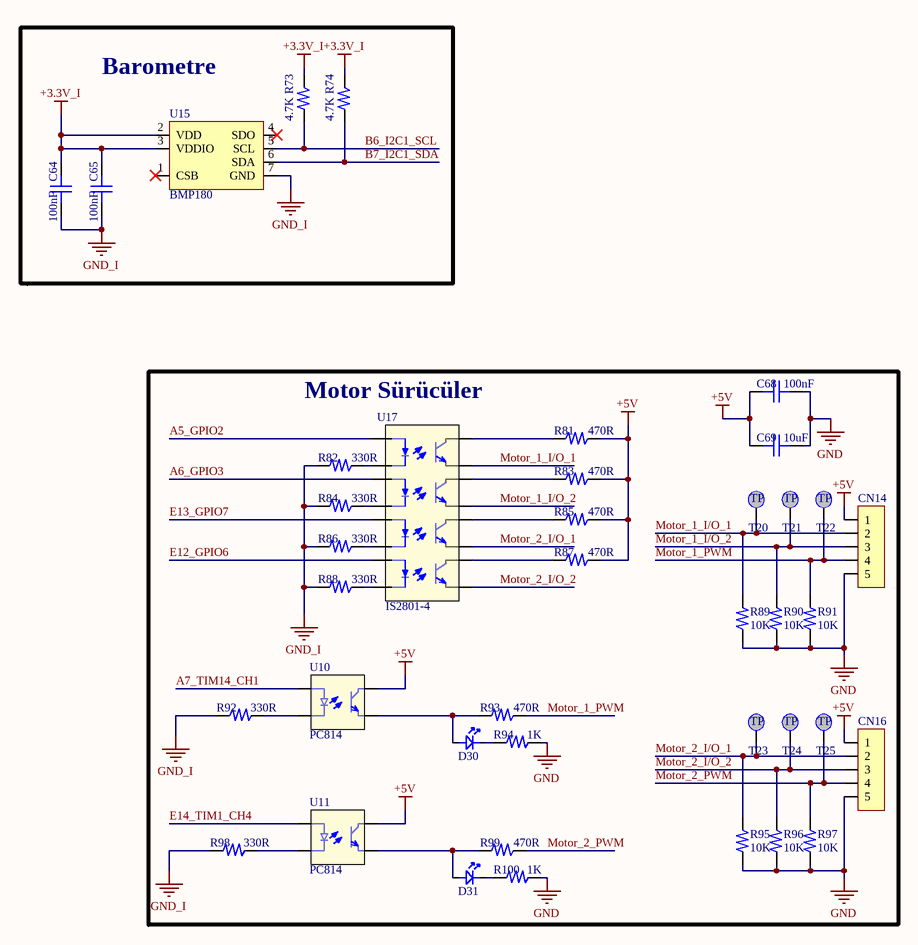
[diagram p5: Dahili Moduller 2.SchDoc]

### Parts
C64  100nF  [0805 Kapasıtor]
C65  100nF  [0805 Kapasıtor]
C68  100nF  [0805 Kapasıtor]
C69  10uF  [0805 Kapasıtor]
CN14  5_Pin_JST_Male  [5_Pin_JST_Male]  (value not drawn)
CN16  5_Pin_JST_Male  [5_Pin_JST_Male]  (value not drawn)
D30  0805 LED  [0805 LED]  (value not drawn)
D31  0805 LED  [0805 LED]  (value not drawn)
R73  4.7K  [0805 Dırenc]
R74  4.7K  [0805 Dırenc]
R81  470R  [0805 Dırenc]
R82  330R  [0805 Dırenc]
R83  470R  [0805 Dırenc]
R84  330R  [0805 Dırenc]
R85  470R  [0805 Dırenc]
R86  330R  [0805 Dırenc]
R87  470R  [0805 Dırenc]
R88  330R  [0805 Dırenc]
R89  10K  [0805 Dırenc]
R90  10K  [0805 Dırenc]
R91  10K  [0805 Dırenc]
R92  330R  [0805 Dırenc]
R93  470R  [0805 Dırenc]
R94  1K  [0805 Dırenc]
R95  10K  [0805 Dırenc]
R96  10K  [0805 Dırenc]
R97  10K  [0805 Dırenc]
R98  330R  [0805 Dırenc]
R99  470R  [0805 Dırenc]
R100  1K  [0805 Dırenc]
T20  Test Noktası  [Test Noktası]  (value not drawn)
T21  Test Noktası  [Test Noktası]  (value not drawn)
T22  Test Noktası  [Test Noktası]  (value not drawn)
T23  Test Noktası  [Test Noktası]  (value not drawn)
T24  Test Noktası  [Test Noktası]  (value not drawn)
T25  Test Noktası  [Test Noktası]  (value not drawn)
U10  PC814  [SOIC4]
U11  PC814  [SOIC4]
U15  BMP180  [BMP180]
U17  IS2801-4  [IS2801-4_ISO]

### Blocks framed on the sheet
Barometre: C64 C65 R73 R74 U15
Motor Sürücüler: C68 C69 CN14 CN16 D30 D31 R81-R100 T20-T25 U10 U11 U17

### Nets
+3.3V_I: C64.2 C65.2 R73.2 R74.2 U15.2(VDD) U15.3(VDDIO)
+5V: C68.2 C69.2 CN14.1 CN16.1 R81.2 R83.2 R85.2 R87.2 U10.4 U11.4
GND: C68.1 C69.1 CN14.5 CN16.5 R89.1 R90.1 R91.1 R94.2 R95.1 R96.1 R97.1 R100.2
GND_I: C64.1 C65.1 R82.1 R84.1 R86.1 R88.1 R92.1 R98.1 U15.7(GND)
A5_GPIO2: U17.1
A6_GPIO3: U17.3
A7_TIM14_CH1: U10.1
B6_I2C1_SCL: R73.1 U15.5(SCL)
B7_I2C1_SDA: R74.1 U15.6(SDA)
E12_GPIO6: U17.7
E13_GPIO7: U17.5
E14_TIM1_CH4: U11.1
Motor_1_I/O_1: CN14.2 R89.2 T20.1 U17.15
Motor_1_I/O_2: CN14.3 R90.2 T21.1 U17.13
Motor_1_PWM: CN14.4 R91.2 R93.2 T22.1
Motor_2_I/O_1: CN16.2 R95.2 T23.1 U17.11
Motor_2_I/O_2: CN16.3 R96.2 T24.1 U17.9
Motor_2_PWM: CN16.4 R97.2 R99.2 T25.1
NetD30_1: D30.1 R93.1 U10.3
NetD30_2: D30.2 R94.1
NetD31_1: D31.1 R99.1 U11.3
NetD31_2: D31.2 R100.1
NetR81_1: R81.1 U17.16
NetR82_2: R82.2 U17.2
NetR83_1: R83.1 U17.14
NetR84_2: R84.2 U17.4
NetR85_1: R85.1 U17.12
NetR86_2: R86.2 U17.6
NetR87_1: R87.1 U17.10
NetR88_2: R88.2 U17.8
NetR92_2: R92.2 U10.2
NetR98_2: R98.2 U11.2

Not connected (* = marked no-connect by the designer): U15 1(CSB)* 4(SDO)*

### Notes on the sheet
- (in symbol Test Noktası) TP

### Library data of the parts
C64 C65 C68 C69 = Kapasitor 0805
R73 R74 R81-R100 = Direnc 0805
U10 U11 = PC814: as U9 on sheet Harici Moduller; Type: Optoisolators; Copyright: Copyright (C) 2026 Ultra Librarian. All rights reserved.; RefDes: RefDes
U17 = IS2801-4: Description; Manufacturer_Name: Isocom; Copyright: Copyright (C) 2025 Ultra Librarian. All rights reserved.; Manufacturer_Part_Number: IS2801-4; RefDes: RefDes; Type: Type

## Sheet Dahili Moduller 3.SchDoc
size A4; SheetNumber: 7; SheetTotal: 7
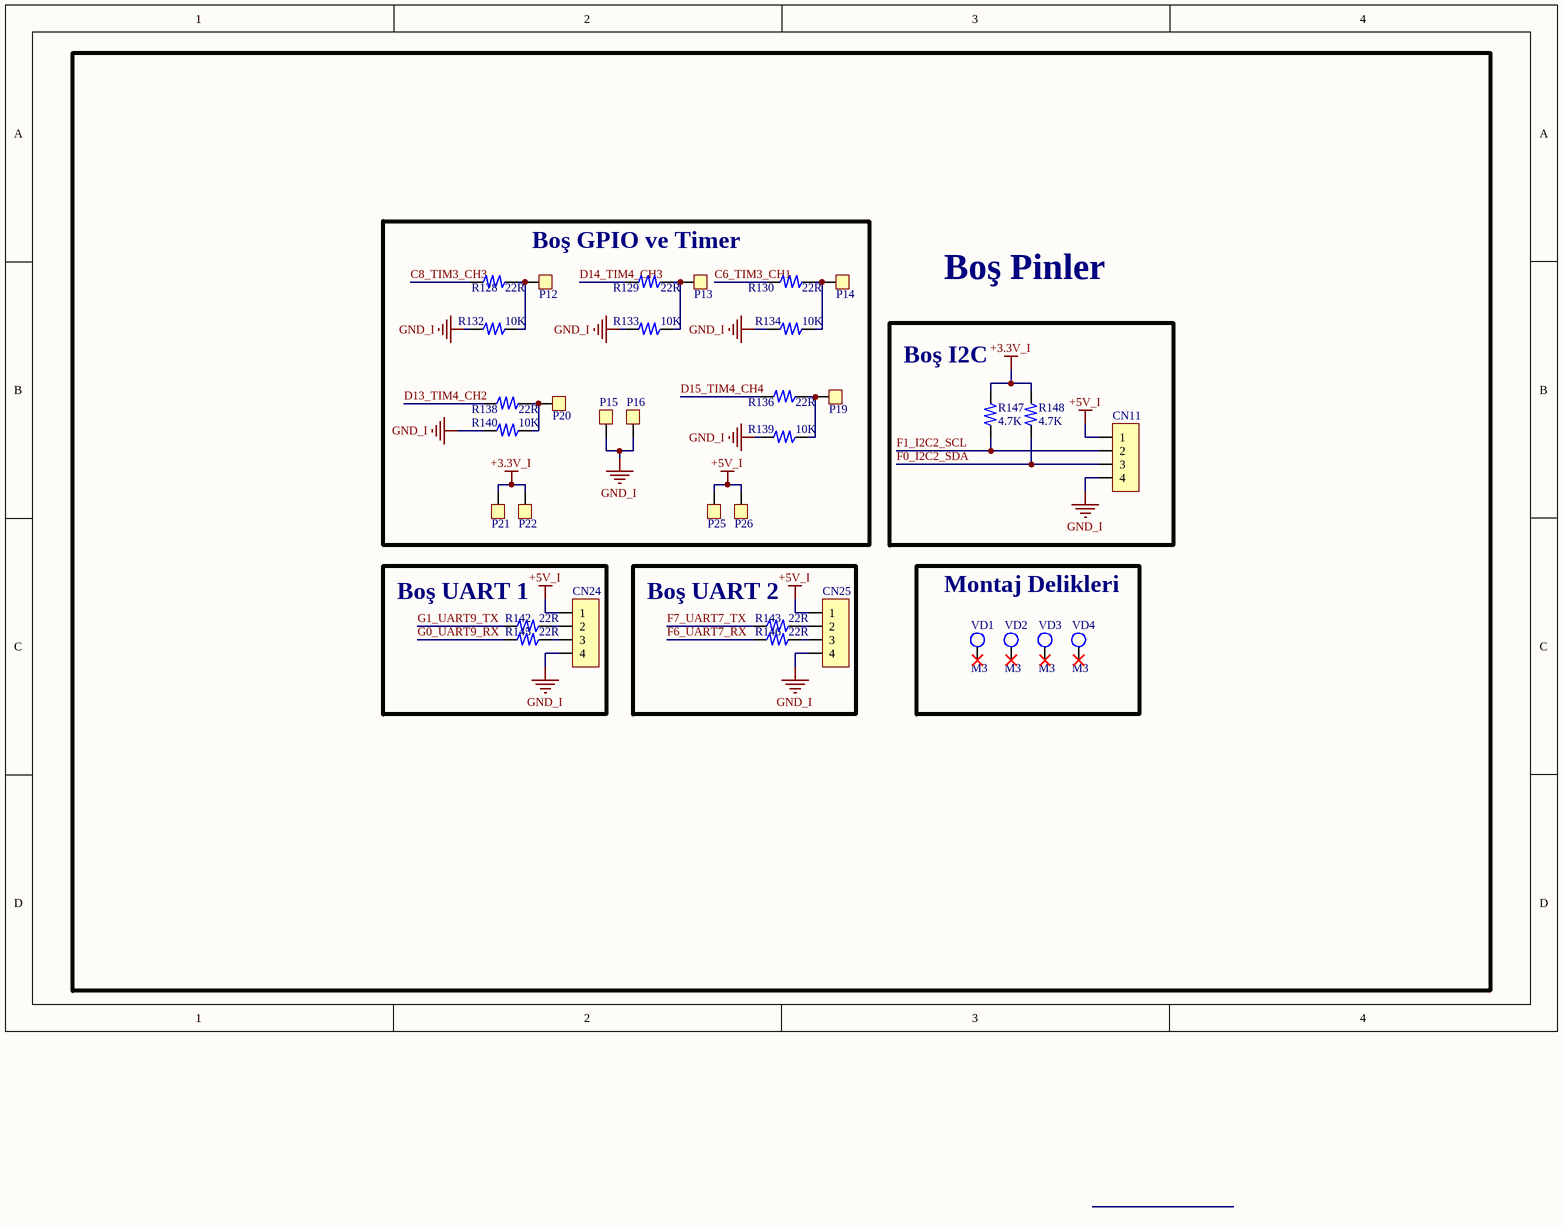
[diagram p6: Dahili Moduller 3.SchDoc]

### Parts
CN11  4_Pin_JST_Male  [4_Pin_JST_Male]  (value not drawn)
CN24  4_Pin_JST_Male  [4_Pin_JST_Male]  (value not drawn)
CN25  4_Pin_JST_Male  [4_Pin_JST_Male]  (value not drawn)
P12  ped  [ped]  (value not drawn)
P13  ped  [ped]  (value not drawn)
P14  ped  [ped]  (value not drawn)
P15  ped  [ped]  (value not drawn)
P16  ped  [ped]  (value not drawn)
P19  ped  [ped]  (value not drawn)
P20  ped  [ped]  (value not drawn)
P21  ped  [ped]  (value not drawn)
P22  ped  [ped]  (value not drawn)
P25  ped  [ped]  (value not drawn)
P26  ped  [ped]  (value not drawn)
R128  22R  [0805 Dırenc]
R129  22R  [0805 Dırenc]
R130  22R  [0805 Dırenc]
R132  10K  [0805 Dırenc]
R133  10K  [0805 Dırenc]
R134  10K  [0805 Dırenc]
R136  22R  [0805 Dırenc]
R138  22R  [0805 Dırenc]
R139  10K  [0805 Dırenc]
R140  10K  [0805 Dırenc]
R142  22R  [0805 Dırenc]
R143  22R  [0805 Dırenc]
R145  22R  [0805 Dırenc]
R146  22R  [0805 Dırenc]
R147  4.7K  [0805 Dırenc]
R148  4.7K  [0805 Dırenc]
VD1  M3  [Vida_Deliği]
VD2  M3  [Vida_Deliği]
VD3  M3  [Vida_Deliği]
VD4  M3  [Vida_Deliği]

### Blocks framed on the sheet
Boş GPIO ve Timer: P12-P16 P19-P22 P25 P26 R128-R130 R132-R134 R136 R138-R140
Boş I2C: CN11 R147 R148
Boş UART 1: CN24 R142 R145
Boş UART 2: CN25 R143 R146
Montaj Delikleri: VD1-VD4

### Nets
+3.3V_I: P21.1 P22.1 R147.2 R148.2
+5V_I: CN11.1 CN24.1 CN25.1 P25.1 P26.1
GND_I: CN11.4 CN24.4 CN25.4 P15.1 P16.1 R132.1 R133.1 R134.1 R139.1 R140.1
C6_TIM3_CH1: R130.1
C8_TIM3_CH3: R128.1
D13_TIM4_CH2: R138.1
D14_TIM4_CH3: R129.1
D15_TIM4_CH4: R136.1
F0_I2C2_SDA: CN11.3 R148.1
F1_I2C2_SCL: CN11.2 R147.1
F6_UART7_RX: R146.1
F7_UART7_TX: R143.1
G0_UART9_RX: R145.1
G1_UART9_TX: R142.1
NetCN24_2: CN24.2 R142.2
NetCN24_3: CN24.3 R145.2
NetCN25_2: CN25.2 R143.2
NetCN25_3: CN25.3 R146.2
NetP12_1: P12.1 R128.2 R132.2
NetP13_1: P13.1 R129.2 R133.2
NetP14_1: P14.1 R130.2 R134.2
NetP19_1: P19.1 R136.2 R139.2
NetP20_1: P20.1 R138.2 R140.2

Not connected (* = marked no-connect by the designer): VD1 1*; VD2 1*; VD3 1*; VD4 1*

### Notes on the sheet
- Boş Pinler

### Library data of the parts
R128-R130 R132-R134 R136 R138-R140 R142 R143 R145-R148 = Direnc 0805
VD1-VD4 = Vida_Deliği

## Nets that join several sheets
+3.3V_I: Power Sematik (5 pins), STM32 Sematik (59 pins), Dahili Moduller 2 (6 pins), Dahili Moduller 3 (P21.1 P22.1 R147.2 R148.2)
+5V: Power Sematik (8 pins), Dahili Moduller 1 (CN4.1 IC1.8), Harici Moduller (CN8.1 U9.4 U12.4 U13.4), Dahili Moduller 2 (10 pins)
+5V_I: Power Sematik (7 pins), Dahili Moduller 1 (20 pins), Harici Moduller (CN9.1), Dahili Moduller 3 (5 pins)
GND: Power Sematik (22 pins), Dahili Moduller 1 (CN4.4 IC1.5 IC1.7 R40.1), Harici Moduller (CN8.2 CN10.2 CN12.2 CN13.2), Dahili Moduller 2 (12 pins)
GND_I: Power Sematik (10 pins), STM32 Sematik (86 pins), Dahili Moduller 1 (32 pins), Harici Moduller (CN9.4 R62.1 R69.2 R71.2), Dahili Moduller 2 (9 pins), Dahili Moduller 3 (10 pins)
A4_GPIO1: STM32 Sematik (U4.49), Harici Moduller (U9.1)
A5_GPIO2: STM32 Sematik (U4.50), Dahili Moduller 2 (U17.1)
A6_GPIO3: STM32 Sematik (U4.51), Dahili Moduller 2 (U17.3)
A7_TIM14_CH1: STM32 Sematik (U4.52), Dahili Moduller 2 (U10.1)
B2_SPI3_MOSI: STM32 Sematik (U4.57), Dahili Moduller 1 (R43.1)
B6_I2C1_SCL: STM32 Sematik (R10.1 T6.1 U4.165), Dahili Moduller 1 (U8.6), Harici Moduller (CN9.2), Dahili Moduller 2 (R73.1 U15.5)
B7_I2C1_SDA: STM32 Sematik (R11.1 T7.1 U4.166), Dahili Moduller 1 (U8.5), Harici Moduller (CN9.3), Dahili Moduller 2 (R74.1 U15.6)
B12_UART5_RX: STM32 Sematik (U4.85), Dahili Moduller 1 (R37.2 T10.1 U5.2)
B13_UART5_TX: STM32 Sematik (U4.86), Dahili Moduller 1 (R38.2 T11.1 U5.3)
B14_USART1_TX: STM32 Sematik (U4.87), Dahili Moduller 1 (IC1.2 R29.2 T8.1)
B15_USART1_RX: STM32 Sematik (U4.88), Dahili Moduller 1 (IC2.6 R39.2 T13.1)
C4_GPIO4: STM32 Sematik (U4.53), Harici Moduller (U13.1)
C5_GPIO5: STM32 Sematik (U4.54), Harici Moduller (U12.1)
C6_TIM3_CH1: STM32 Sematik (U4.122), Dahili Moduller 3 (R130.1)
C8_TIM3_CH3: STM32 Sematik (U4.124), Dahili Moduller 3 (R128.1)
C10_SPI3_SCK: STM32 Sematik (U4.140), Dahili Moduller 1 (R60.2 T17.1 U7.3)
C11_SPI3_MISO: STM32 Sematik (U4.141), Dahili Moduller 1 (R59.2 T16.1 U7.2)
C12_SPI6_SCK: STM32 Sematik (U4.142), Dahili Moduller 1 (R56.2 T15.1 U6.3)
D13_TIM4_CH2: STM32 Sematik (U4.96), Dahili Moduller 3 (R138.1)
D14_TIM4_CH3: STM32 Sematik (U4.97), Dahili Moduller 3 (R129.1)
D15_TIM4_CH4: STM32 Sematik (U4.98), Dahili Moduller 3 (R136.1)
E12_GPIO6: STM32 Sematik (U4.74), Dahili Moduller 2 (U17.7)
E13_GPIO7: STM32 Sematik (U4.75), Dahili Moduller 2 (U17.5)
E14_TIM1_CH4: STM32 Sematik (U4.76), Dahili Moduller 2 (U11.1)
F0_I2C2_SDA: STM32 Sematik (U4.18), Dahili Moduller 3 (CN11.3 R148.1)
F1_I2C2_SCL: STM32 Sematik (U4.19), Dahili Moduller 3 (CN11.2 R147.1)
F6_UART7_RX: STM32 Sematik (U4.26), Dahili Moduller 3 (R146.1)
F7_UART7_TX: STM32 Sematik (U4.27), Dahili Moduller 3 (R143.1)
G0_UART9_RX: STM32 Sematik (U4.63), Dahili Moduller 3 (R145.1)
G1_UART9_TX: STM32 Sematik (U4.66), Dahili Moduller 3 (R142.1)
G12_SPI6_MISO: STM32 Sematik (U4.156), Dahili Moduller 1 (R55.2 T14.1 U6.2)
G14_SPI6_MOSI: STM32 Sematik (U4.158), Dahili Moduller 1 (R41.1)